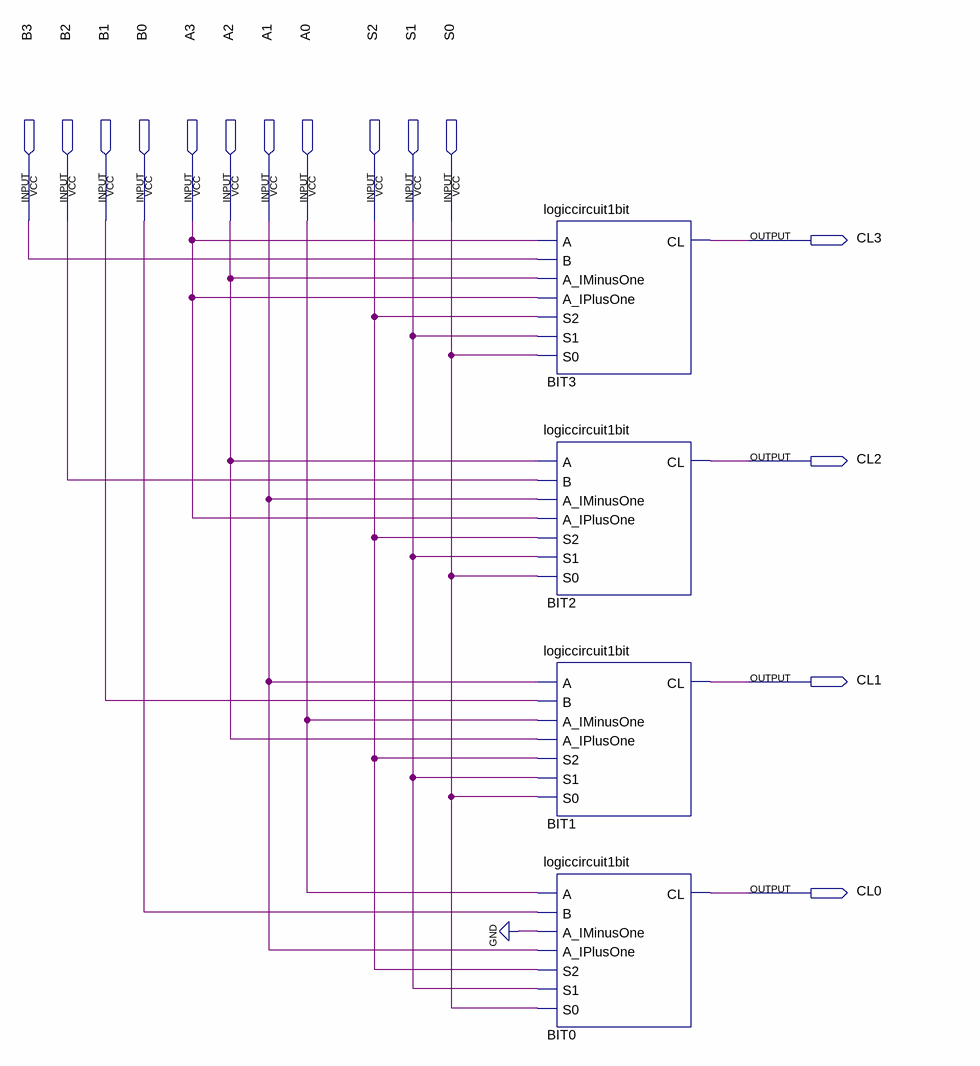
[diagram p0: schematic sheet]
// Quartus schematic logiccircuit4bit.bdf as structural Verilog: 4 symbols, 15 pins
module logiccircuit4bit (
  input  B3,
  input  B2,
  input  B1,
  input  B0,
  input  A3,
  input  A2,
  input  A1,
  input  A0,
  input  S2,
  input  S1,
  input  S0,
  output CL3,
  output CL2,
  output CL1,
  output CL0
);

  logiccircuit1bit BIT3 (.A(A3), .B(B3), .A_IMinusOne(A2), .A_IPlusOne(A3), .S2(S2), .S1(S1), .S0(S0), .CL(CL3));
  logiccircuit1bit BIT2 (.A(A2), .B(B2), .A_IMinusOne(A1), .A_IPlusOne(A3), .S2(S2), .S1(S1), .S0(S0), .CL(CL2));
  logiccircuit1bit BIT1 (.A(A1), .B(B1), .A_IMinusOne(A0), .A_IPlusOne(A2), .S2(S2), .S1(S1), .S0(S0), .CL(CL1));
  logiccircuit1bit BIT0 (.A(A0), .B(B0), .A_IMinusOne(1'b0), .A_IPlusOne(A1), .S2(S2), .S1(S1), .S0(S0), .CL(CL0));
endmodule
